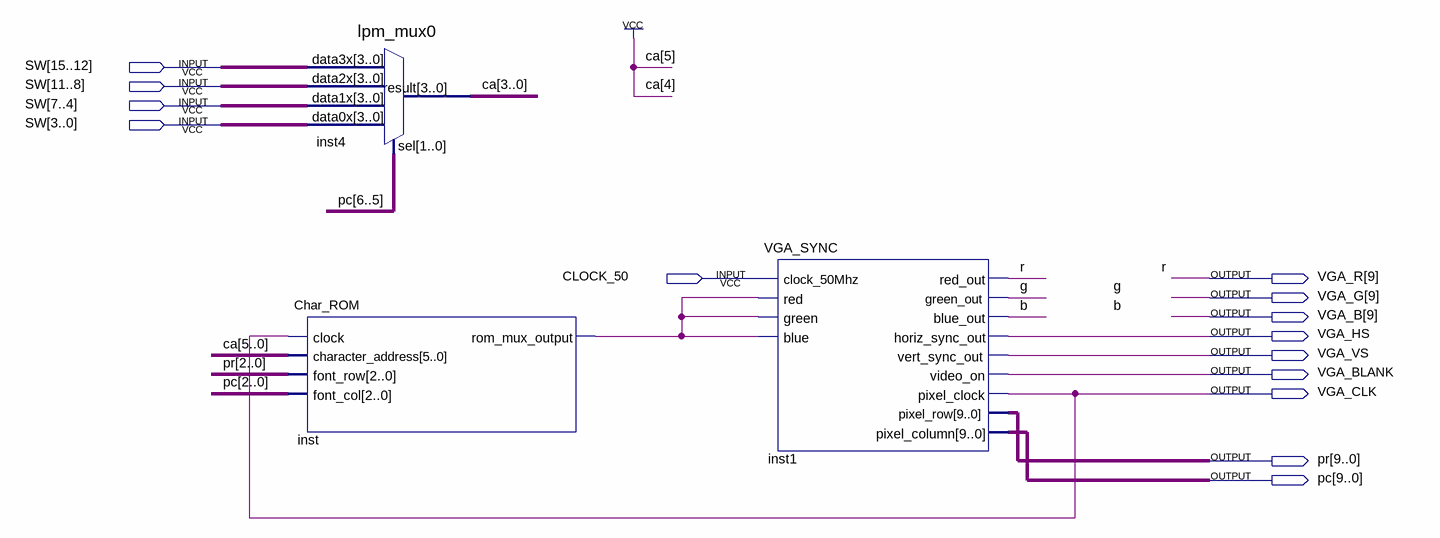
[diagram p0: schematic sheet]
// Quartus schematic VGA_CHAR_TEST.bdf as structural Verilog: 3 symbols, 14 pins
module VGA_CHAR_TEST (
  input  [15:0] SW,
  input  CLOCK_50,
  output [9:9] VGA_R,
  output [9:9] VGA_G,
  output [9:9] VGA_B,
  output VGA_HS,
  output VGA_VS,
  output VGA_BLANK,
  output VGA_CLK,
  output [9:0] pr,
  output [9:0] pc
);

  wire inst_rom_mux_output;
  wire [3:0] ca;

  lpm_mux0 inst4 (
    .data3x(SW[15:12]), .data2x(SW[11:8]), .data1x(SW[7:4]), .data0x(SW[3:0]), .sel(pc[6:5]), .result(ca));
  Char_ROM inst (
    .clock(VGA_CLK), .character_address({2'b11, ca}), .font_row(pr[2:0]), .font_col(pc[2:0]),
    .rom_mux_output(inst_rom_mux_output));
  VGA_SYNC inst1 (
    .clock_50Mhz(CLOCK_50), .red(inst_rom_mux_output), .green(inst_rom_mux_output),
    .blue(inst_rom_mux_output), .red_out(VGA_R[9]), .green_out(VGA_G[9]), .blue_out(VGA_B[9]),
    .horiz_sync_out(VGA_HS), .vert_sync_out(VGA_VS), .video_on(VGA_BLANK), .pixel_clock(VGA_CLK),
    .pixel_row(pr), .pixel_column(pc));

  // Other names for the same wires on the sheet: b = VGA_B[9]; g = VGA_G[9]; r = VGA_R[9]
endmodule
